# Altium project phase_shifter.PrjPcb
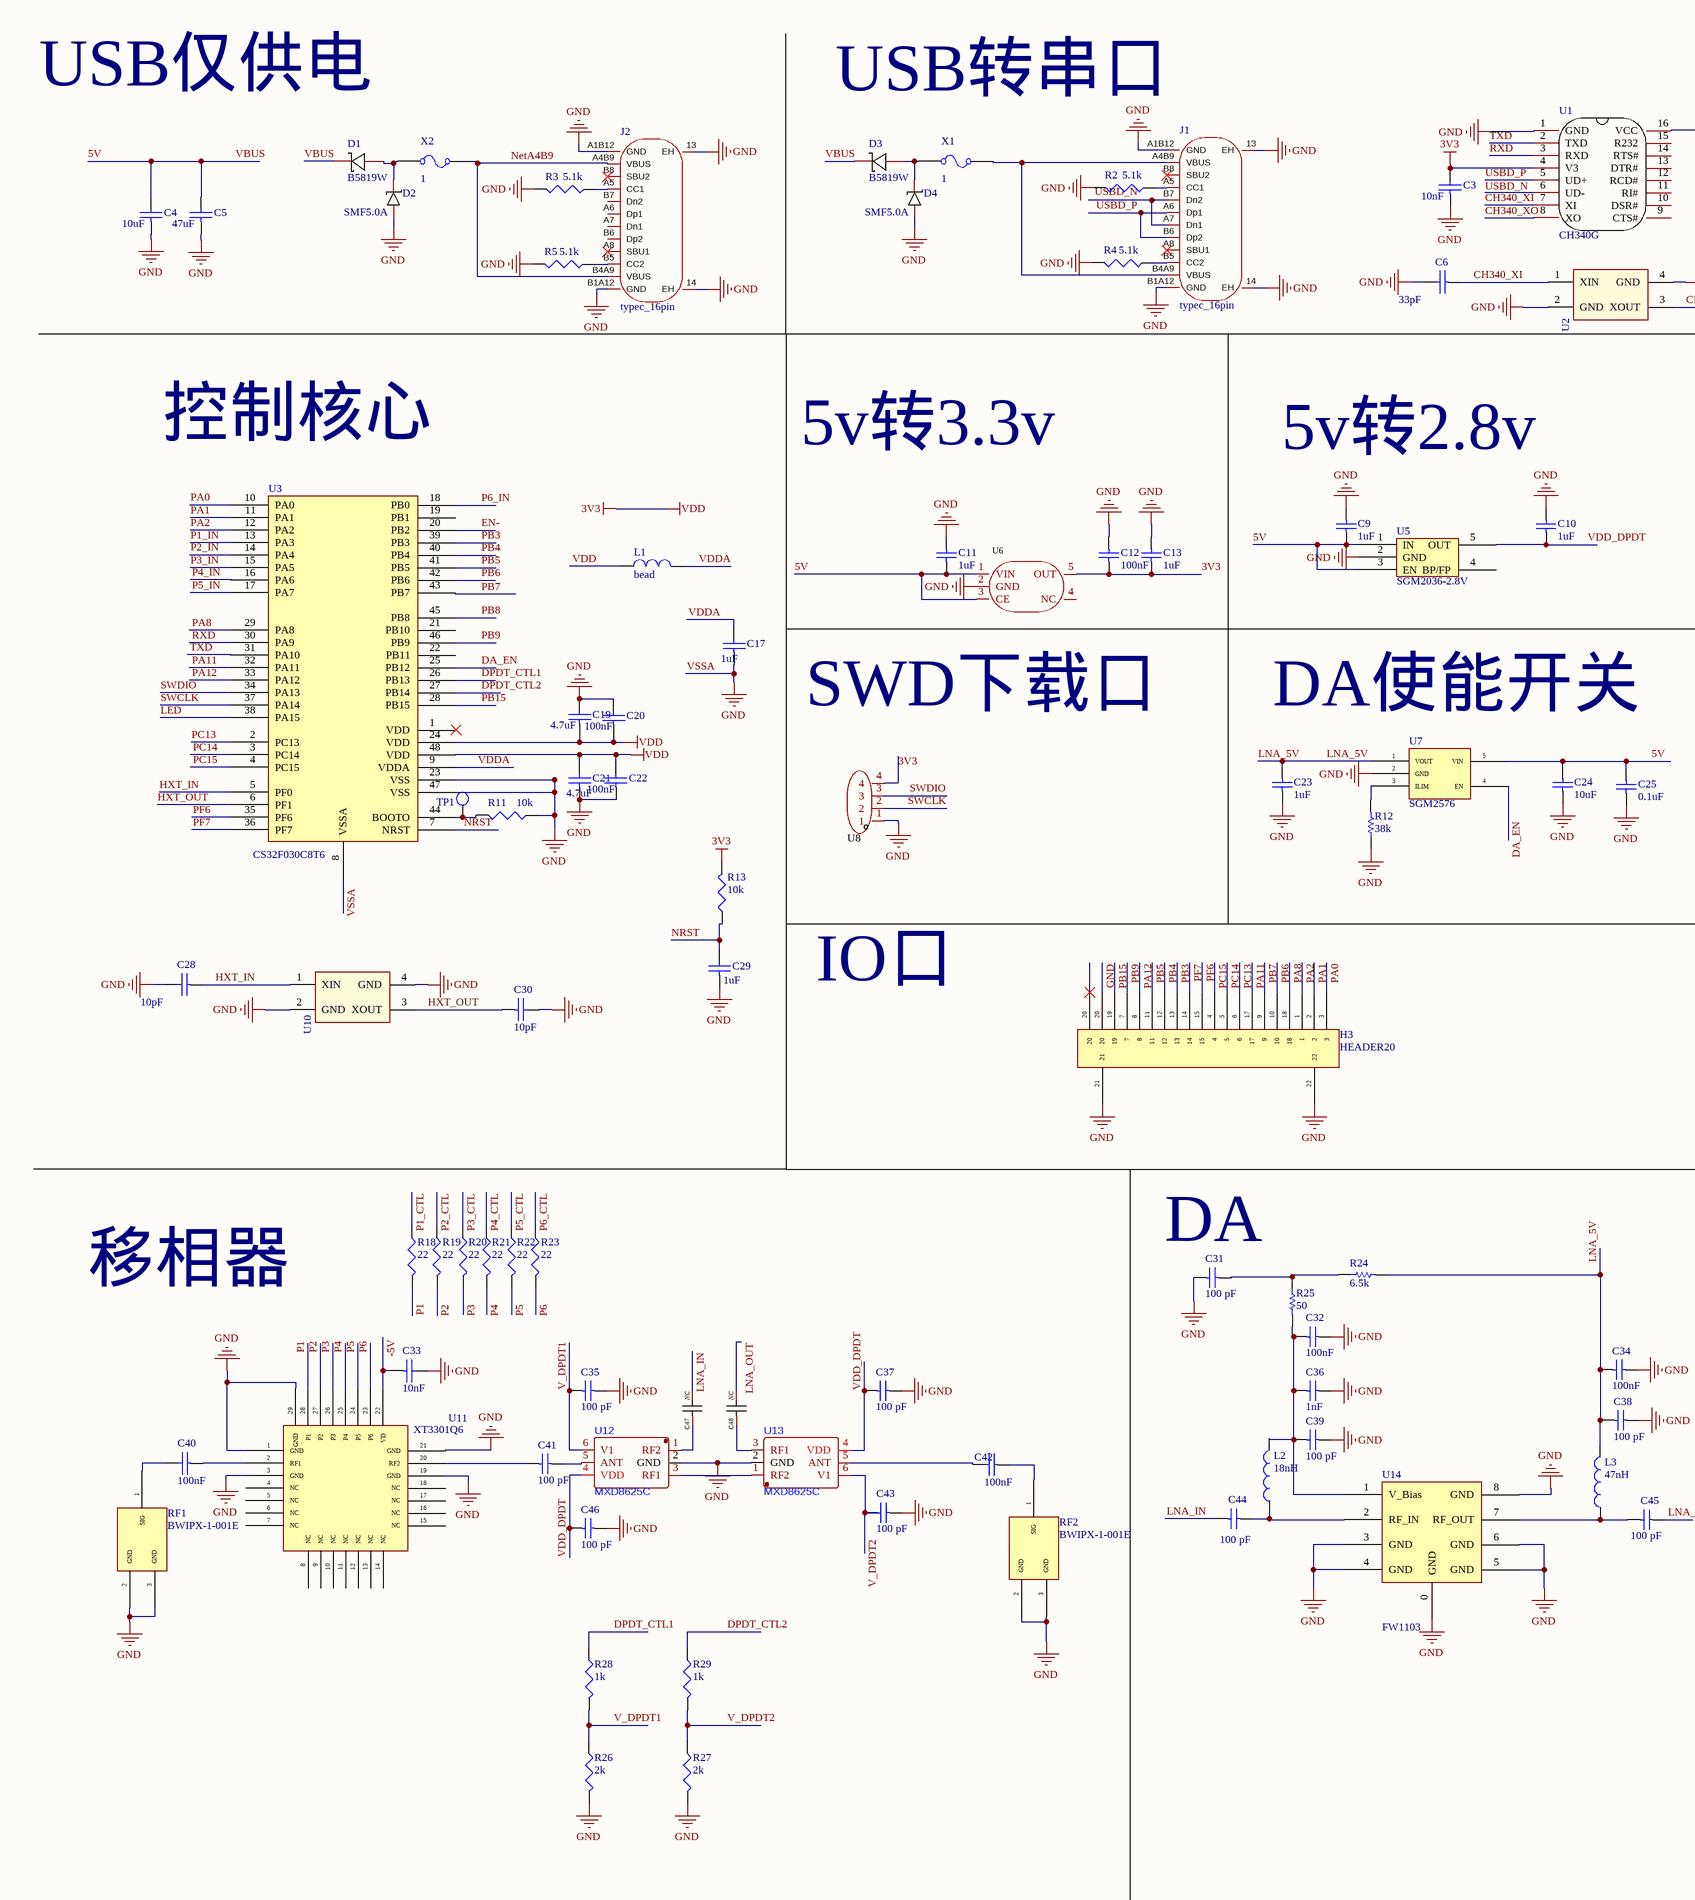
[diagram p0: SHIFTER.SchDoc, left]
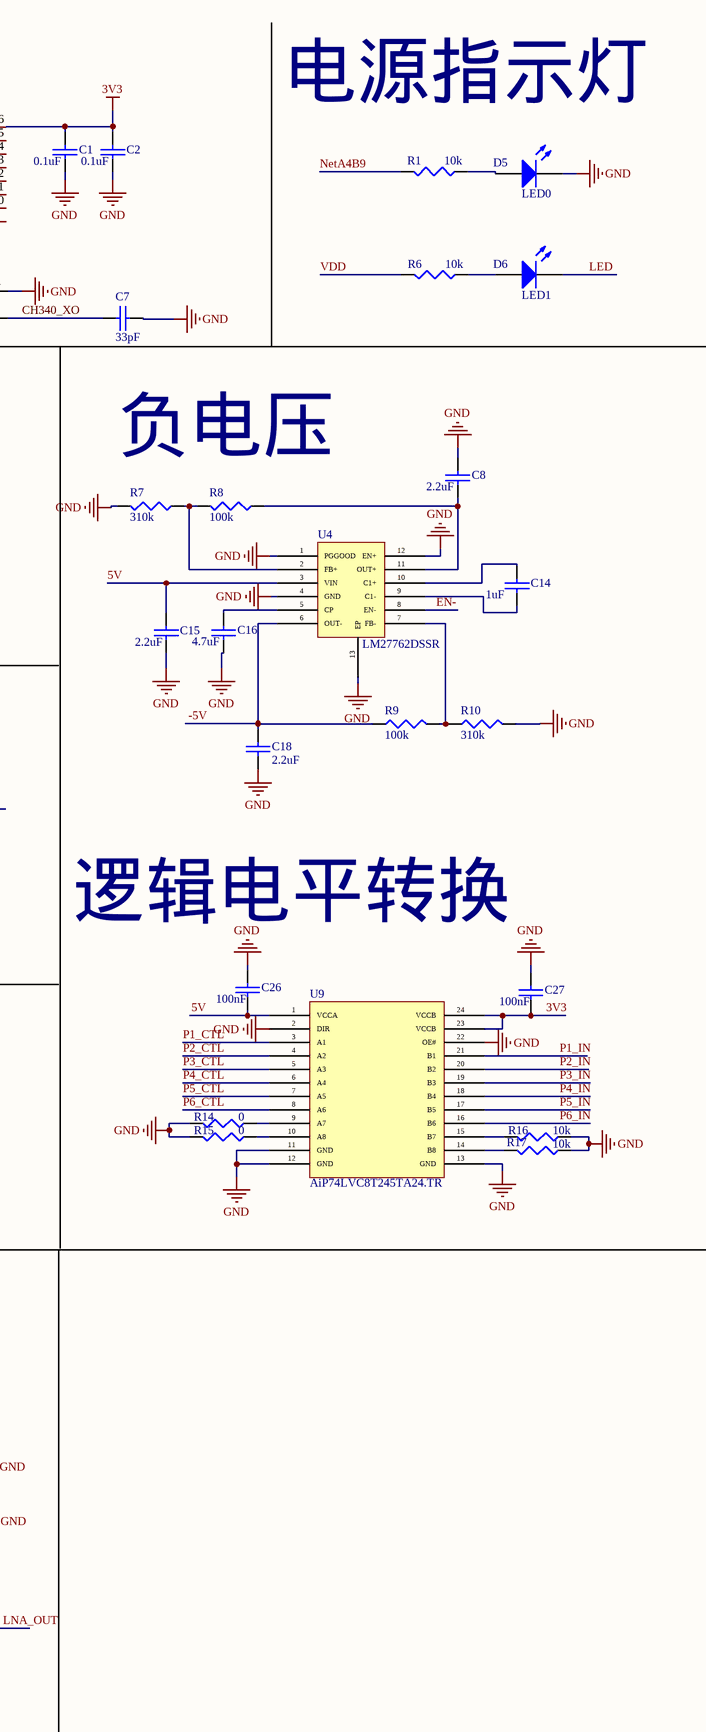
[diagram p1: SHIFTER.SchDoc, right]
6 sheets, 108 parts. Net scope: flat (ports and power ports of the same name join across sheets).
Board files: PHASE_SHIFTER.PcbDoc, shifter_V2.PcbDoc
Sheets:
  SHIFTER.SchDoc
  TOP.SchDoc

## Sheet SHIFTER.SchDoc
size A2; SheetNumber: 1; SheetTotal: 6

### Parts
C1  0.1uF  [0402_Z]
C2  0.1uF  [0402_Z]
C3  10nF  [0402_Z]
C4  10uF  [0603_Z]
C5  47uF  [0805]
C6  33pF  [0402_Z]
C7  33pF  [0402_Z]
C8  2.2uF  [0402_Z]
C9  1uF  [0603_Z]
C10  1uF  [0603_Z]
C11  1uF  [0603_Z]
C12  100nF  [0603_Z]
C13  1uF  [0603_Z]
C14  1uF  [0402_Z]
C15  2.2uF  [0402_Z]
C16  4.7uF  [0603_Z]
C17  1uF  [0402_Z]
C18  2.2uF  [0402_Z]
C19  4.7uF  [0603_Z]
C20  100nF  [0402_Z]
C21  4.7uF  [0603_Z]
C22  100nF  [0402_Z]
C23  1uF  [0603_Z]
C24  10uF  [0603_Z]
C25  0.1uF  [0402_Z]
C26  100nF  [0402_Z]
C27  100nF  [0402_Z]
C28  10pF  [0402_Z]
C29  1uF  [0402_Z]
C30  10pF  [0402_Z]
C31  100 pF  [0402_Z]
C32  100nF  [0402_Z]
C33  10nF  [0402_Z]
C34  100nF  [0402_Z]
C35  100 pF  [0402_Z]
C36  1nF  [0402_Z]
C37  100 pF  [0402_Z]
C38  100 pF  [0402_Z]
C39  100 pF  [0402_Z]
C40  100nF  [0603_Z]
C41  100 pF  [0402_Z]
C42  100nF  [0603_Z]
C43  100 pF  [0402_Z]
C44  100 pF  [0402_Z]
C45  100 pF  [0402_Z]
C46  100 pF  [0402_Z]
C47  NC  [0603_Z]  (no BOM)
C48  NC  [0603_Z]  (no BOM)
D1  B5819W  [BW5819W]
D2  SMF5.0A  [SMF5.0A]
D3  B5819W  [BW5819W]
D4  SMF5.0A  [SMF5.0A]
D5  LED0  [0603_Z]
D6  LED1  [0603_Z]
H3  HEADER20  [Header20]
J1  typec_16pin  [TYPEC_16PIN]
J2  typec_16pin  [TYPEC_16PIN]
L1  bead  [0603_Z]
L2  18nH  [0402_Z]
L3  47nH  [0402_Z]
R1  10k  [0402_Z]
R2  5.1k  [0402_Z]
R3  5.1k  [0402_Z]
R4  5.1k  [0402_Z]
R5  5.1k  [0402_Z]
R6  10k  [0402_Z]
R7  310k  [0402_Z]
R8  100k  [0402_Z]
R9  100k  [0402_Z]
R10  310k  [0402_Z]
R11  10k  [0402_Z]
R12  38k  [0402_Z]
R13  10k  [0402_Z]
R14  0  [0402_Z]
R15  0  [0402_Z]
R16  10k  [0402_Z]
R17  10k  [0402_Z]
R18  22  [0402_Z]
R19  22  [0402_Z]
R20  22  [0402_Z]
R21  22  [0402_Z]
R22  22  [0402_Z]
R23  22  [0402_Z]
R24  6.5k  [0402_Z]
R25  50  [0402_Z]
R26  2k  [0402_Z]
R27  2k  [0402_Z]
R28  1k  [0402_Z]
R29  1k  [0402_Z]
RF1  BWIPX-1-001E  [SMA-SMD_BWSMA-KE-P001]
RF2  BWIPX-1-001E  [SMA-SMD_BWSMA-KE-P001]
TP1  TP_P  [TP_0.8]  (value not drawn)
U1  CH340G  [CH340G]
U2  12MHz  [CRYSTAL-SMD_4P-L3.2-W2.5-BL]  (value not drawn)
U3  CS32F030C8T6  [LQPF48]
U4  LM27762DSSR  [LM27762]
U5  SGM2036-2.8V  [SOT-23-5]
U6  SGM2036-3.3YN5G/TR  [SOT-23-5]  (value not drawn)
U7  SGM2576  [SGM2576]
U8  HDGC1251WR-4P  [J4_1.25]  (value not drawn)
U9  AiP74LVC8T245TA24.TR  [AIP74LVC8T245TA24.TR]
U10  8MHz  [CRYSTAL-SMD_4P-L3.2-W2.5-BL]  (value not drawn)
U11  XT3301Q6  [XT3301Q6]
U12  MXD8625C  [MXD8625C]
U13  MXD8625C  [MXD8625C]
U14  FW1103  [FW1103W]
X1  CURRENT: 1  [F1206]  (hidden comment: Fuse)
X2  CURRENT: 1  [F1206]  (hidden comment: Fuse)

### Nets
3V3: C1.2 C2.2 C3.2 C12.1 C13.1 C19.1 C20.1 C21.2 C22.2 C27.1 L1.1 R6.2 R13.2 U1.4(V3) U1.16(VCC) U3.24(VDD) U3.48(VDD) U6.5(OUT) U8.4 U9.23(VCCB) U9.24(VCCB)  [also labelled VDD]
GND: C1.1 C2.1 C3.1 C4.1 C5.1 C6.2 C7.2 C8.2 C9.2 C10.2 C11.2 C12.2 C13.2 C15.1 C16.1 C17.1 C18.2 C19.2 C20.2 C21.1 C22.1 C23.1 C24.1 C25.1 C26.2 C27.2 C28.2 C29.1 C30.2 C31.2 C32.1 C33.2 C34.1 C35.1 C36.1 C37.1 C38.1 C39.1 C43.1 C46.1 D2.2 D4.2 D5.2(K) H3.20 H3.21 H3.22 J1.13(EH) J1.14(EH) J1.A1B12(GND) J1.B1A12(GND) J2.13(EH) J2.14(EH) J2.A1B12(GND) J2.B1A12(GND) R2.2 R3.2 R4.2 R5.2 R7.2 R10.2 R11.1 R12.1 R14.2 R15.2 R16.1 R17.1 R26.2 R27.2 RF1.2(GND) RF1.3(GND) RF2.2(GND) RF2.3(GND) U1.1(GND) U2.2(GND) U2.4(GND) U3.8(VSSA) U3.23(VSS) U3.47(VSS) U4.1(PGGOOD) U4.4(GND) U4.12(EN+) U4.13(EP) U5.2(GND) U6.2(GND) U7.2(GND) U8.1 U9.2(DIR) U9.11(GND) U9.12(GND) U9.13(GND) U9.22(OE#) U10.2(GND) U10.4(GND) U11.1(GND) U11.3(GND) U11.19(GND) U11.21(GND) U11.29(GND) U12.2(GND) U13.2(GND) U14.0(GND) U14.3(GND) U14.4(GND) U14.5(GND) U14.6(GND) U14.8(GND)  [also labelled VSSA]
5V: C4.2 C5.2 C9.1 C11.1 C15.2 C24.2 C25.2 C26.1 D1.1(K) D3.1(K) U4.3(VIN) U5.1(IN) U5.3(EN) U6.1(VIN) U6.3(CE) U7.5(VIN) U9.1(VCCA)  [also labelled VBUS]
-5V: C18.1 C33.1 R9.1 U4.6(OUT-) U11.22(VD)
\: R28.1 U3.26(PB13)  [also labelled DPDT_CTL1]
CH340_XI: C6.1 U1.7(XI) U2.1(XIN)
CH340_XO: C7.1 U1.8(XO) U2.3(XOUT)
DA_EN: U3.25(PB12) U7.4(EN)
DPDT_CTL2: R29.1 U3.27(PB14)
EN-: U3.20(PB2) U4.8(EN-)
HXT_IN: C28.1 U3.5(PF0) U10.1(XIN)
HXT_OUT: C30.1 U3.6(PF1) U10.3(XOUT)
LED: D6.2(K) U3.38(PA15)
LNA_5V: C23.2 C34.2 C38.2 L3.2 R24.2 U7.1(VOUT)
LNA_IN: C44.2 C47.2
LNA_OUT: C45.1 C48.2
NetA4B9: J2.A4B9(VBUS) J2.B4A9(VBUS) R1.2 X2.2
NRST: C29.2 R13.1 U3.7(NRST)
P1: R18.2 U11.28(P1)
P1_CTL: R18.1 U9.3(A1)
P1_IN: U3.13(PA3) U9.21(B1)
P2: R19.2 U11.27(P2)
P2_CTL: R19.1 U9.4(A2)
P2_IN: U3.14(PA4) U9.20(B2)
P3: R20.2 U11.26(P3)
P3_CTL: R20.1 U9.5(A3)
P3_IN: U3.15(PA5) U9.19(B3)
P4: R21.2 U11.25(P4)
P4_CTL: R21.1 U9.6(A4)
P4_IN: U3.16(PA6) U9.18(B4)
P5: R22.2 U11.24(P5)
P5_CTL: R22.1 U9.7(A5)
P5_IN: U3.17(PA7) U9.17(B5)
P6: R23.2 U11.23(P6)
P6_CTL: R23.1 U9.8(A6)
P6_IN: U3.18(PB0) U9.16(B6)
PA0: H3.3 U3.10(PA0)
PA1: H3.2 U3.11(PA1)
PA2: H3.1 U3.12(PA2)
PA8: H3.18 U3.29(PA8)
PA11: H3.17 U3.32(PA11)
PA12: H3.8 U3.33(PA12)
PB3: H3.13 U3.39(PB3)
PB4: H3.12 U3.40(PB4)
PB5: H3.11 U3.41(PB5)
PB6: H3.10 U3.42(PB6)
PB7: H3.9 U3.43(PB7)
PB8: U3.45(PB8)
PB9: H3.7 U3.46(PB9)
PB15: H3.19 U3.28(PB15)
PC13: H3.6 U3.2(PC13)
PC14: H3.5 U3.3(PC14)
PC15: H3.4 U3.4(PC15)
PF6: H3.15 U3.35(PF6)
PF7: H3.14 U3.36(PF7)
RXD: U1.3(RXD) U3.30(PA9)
SWCLK: U3.37(PA14) U8.2
SWDIO: U3.34(PA13) U8.3
TXD: U1.2(TXD) U3.31(PA10)
USBD_P: J1.A6(Dp1) J1.B6(Dp2) U1.5(UD+)
V_DPDT1: C35.2 R26.1 R28.2 U12.6(V1)
V_DPDT2: R27.1 R29.2
VDD_DPDT: C10.1 C37.2 C46.2 U5.5(OUT) U12.4(VDD) U13.4(VDD)
VDDA: C17.2 L1.2 U3.9(VDDA)
NetC8_1: C8.1 R8.1 U4.11(OUT+)
NetC14_1: C14.1 U4.9(C1-)
NetC14_2: C14.2 U4.10(C1+)
NetC16_2: C16.2 U4.5(CP)
NetC31_1: C31.1 R24.1 R25.1
NetC32_2: C32.2 C36.2 C39.2 L2.2 R25.2 U14.1(V_Bias)
NetC40_1: C40.1 U11.2(RF1)
NetC40_2: C40.2 RF1.1(SIG)
NetC41_1: C41.1 U12.5(ANT)
NetC41_2: C41.2 U11.20(RF2)
NetC42_1: C42.1 RF2.1(SIG)
NetC42_2: C42.2 U13.5(ANT)
NetC43_2: C43.2 U13.6(V1)
NetC44_1: C44.1 L2.1 U14.2(RF_IN)
NetC45_2: C45.2 L3.1 U14.7(RF_OUT)
NetC47_1: C47.1 U12.1(RF2)
NetC48_1: C48.1 U13.3(RF1)
NetD1_2: D1.2(A) D2.1 X2.1
NetD3_2: D3.2(A) D4.1 X1.1
NetD5_1: D5.1(A) R1.1
NetD6_1: D6.1(A) R6.1
NetJ1_A4B9: J1.A4B9(VBUS) J1.B4A9(VBUS) X1.2
NetJ1_A5: J1.A5(CC1) R2.1
NetJ1_A7: J1.A7(Dn1) J1.B7(Dn2)
NetJ1_B5: J1.B5(CC2) R4.1
NetJ2_A5: J2.A5(CC1) R3.1
NetJ2_B5: J2.B5(CC2) R5.1
NetR7_1: R7.1 R8.2 U4.2(FB+)
NetR9_2: R9.2 R10.1 U4.7(FB-)
NetR11_2: R11.2 TP1.1 U3.44(BOOTO)
NetR12_2: R12.2 U7.3(ILIM)
NetR14_1: R14.1 U9.9(A7)
NetR15_1: R15.1 U9.10(A8)
NetR16_2: R16.2 U9.15(B7)
NetR17_2: R17.2 U9.14(B8)
NetU12_3: U12.3(RF1) U13.1(RF2)

Not connected (* = marked no-connect by the designer): J1 A8(SBU1)* B8(SBU2)*; J2 A6(Dp1) A7(Dn1) A8(SBU1)* B6(Dp2) B7(Dn2) B8(SBU2)*; U1 6(UD-) 9(CTS#) 10(DSR#) 11(RI#) 12(RCD#) 13(DTR#) 14(RTS#) 15(R232); U3 1(VDD) 19(PB1) 21(PB10) 22(PB11); U5 4(BP/FP); U6 4(NC); U11 4(NC) 5(NC) 6(NC) 7(NC) 8(NC) 9(NC) 10(NC) 11(NC) 12(NC) 13(NC) 14(NC) 15(NC) 16(NC) 17(NC) 18(NC)

### Notes on the sheet
- USB仅供电
- USB转串口
- 电源指示灯
- 控制核心
- 5v转3.3v
- 5v转2.8v
- 负电压
- SWD下载口
- DA使能开关
- (near C26) 逻辑电平转换
- IO口
- 移相器
- (near C31) DA
- Labels drawn without touching a wire or pin: USBD_N

### Library data of the parts
C1-C8 C14-C22 C26-C30 C33 C40 C42 = CAP: 0402; Value: 20pF  NP0
C9-C13 C23-C25 C31 C32 C34-C39 C41 C43-C46 = Cap: Capacitor; Value: 100pF; Published: 8-Jun-2000; LatestRevisionDate: 17-Jul-2002; LatestRevisionNote: Re-released for DXP Platform.; PackageReference: RAD-0.3; Publisher: Altium Limited; PackageDescription: Radial Cap, Thru-Hole; 2 Leads; 0.3 in Pin Spacing
C47 C48 = Cap_NC
D1 D3 = B5819W: 肖特基二极管
D5 D6 = LED0: Typical INFRARED GaAs LED; Published: 8-Jun-2000; LatestRevisionDate: 08-Jul-2005; LatestRevisionNote: Mech Layer 1 removed.; PackageReference: LED-0; Publisher: Altium Limited; PackageDescription: LED; 2 Leads
L1 = INDUCTOR1_1: INDUCTOR; Value: 33nH
L2 L3 = Inductor: Code_IEC: 1005; Value: 10mH; Published: 8-Jun-2000; LatestRevisionDate: 29-May-2009; LatestRevisionNote: IPC-7351 Footprint Added.; PackageReference: 0402-A; Publisher: Altium Limited; PackageDescription: Chip Inductor; Code_JEITA: 0402
R1-R11 R13-R23 R26-R29 = Res3: Resistor; Published: 8-Jun-2000; LatestRevisionDate: 04-Mar-2005; LatestRevisionNote: PCB Footprint replaced.; PackageReference: J1-0603; Publisher: Altium Limited
  R1 R6 R11 R13 R16 R17: Value: 10k
  R2-R5: Value: 5.1k
  R7 R10: Value: 310k
  R8 R9: Value: 100k
  R14 R15: Value: 0
  R18-R23: Value: 22
  R26 R27: Value: 2k
  R28 R29: Value: 1k
R12 R24 R25 = Res1: Resistor; Value: 1K; Published: 8-Jun-2000; LatestRevisionDate: 17-Jul-2002; LatestRevisionNote: Re-released for DXP Platform.; PackageReference: AXIAL-0.3; Publisher: Altium Limited; PackageDescription: Axial Device, Thru-Hole; 2 Leads; 0.3 in Pin Spacing
U2 U10 = XTAL 3225: PCB DECAL: 3225; Source_Path: E:\LI LELE\DESIGN KIT\DESIGN KIT_ESP8089_DEMO\ESP8089_DEMO.DSN
U5 = sgm2036
U6 = LDO_ADJ_SGM2036: 0.8V-5V可调输出线性稳压器; Designer: U?; Symbol: SGM2036-3.3YN5G/TR; Device: SGM2036-3.3YN5G/TR
U8 = MX1.25_弯针: 复旦微单片机程序下载接口; Manufacturer: HDGC(华德共创); Add into BOM: yes; Name: HDGC1251WR-4P; Symbol: HDGC1251WR-4P; Device: HDGC1251WR-4P; LCSC Part Name: MX1.25弯针 4P; Supplier Part: C5175205; Manufacturer Part: HDGC1251WR-4P; Supplier Footprint: 直插,P=1.25mm; JLCPCB Part Class: Extended Part; Datasheet: https://atta.szlcsc.com/upload/public/pdf/source/20220916/6B39EFECC0008CEF03BA0E93409F6DCC.pdf; Supplier: LCSC; Convert to PCB: yes
U9 = AiP74LVC8T245TA24.TR: 具有三态输出的8位双电源转换收发器，可实现双向电平转换
X1 X2 = Fuse: RESISTANCE: 1m; SimulationGenericComponent: True

## Sheet TOP.SchDoc
size A2; SheetNumber: 6; SheetTotal: 6
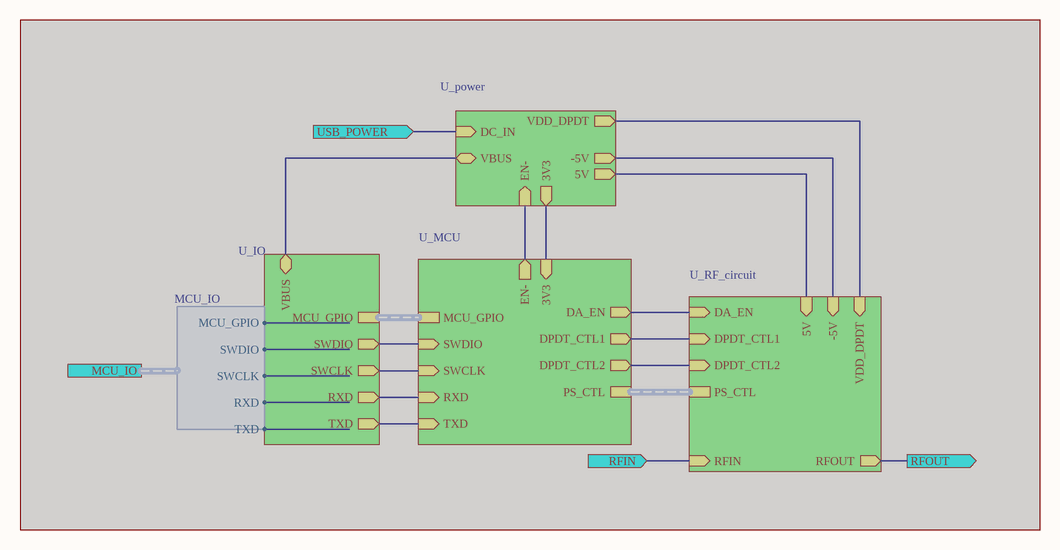
[diagram p2: TOP.SchDoc]

### Sub-sheets
U_IO = IO.SchDoc (masked out): SWDIO (out), SWCLK (out), MCU_GPIO (harness MCU_GPIO), TXD (out), RXD (out), VBUS (bidir)
U_MCU = MCU.SchDoc (masked out): MCU_GPIO (harness MCU_GPIO), 3V3 (in), EN- (out), DA_EN (out), DPDT_CTL1 (out), DPDT_CTL2 (out), SWDIO (in), SWCLK (in), RXD (in), TXD (in), PS_CTL (harness PS_CTL)
U_power = power.SchDoc (masked out): 3V3 (out), VDD_DPDT (out), -5V (out), 5V (out), EN- (in), VBUS (bidir), DC_IN (in)
U_RF_circuit = RF_circuit.SchDoc (masked out): -5V (in), DPDT_CTL1 (in), DPDT_CTL2 (in), PS_CTL (harness PS_CTL), DA_EN (in), VDD_DPDT (in), 5V (in), RFIN (in), RFOUT (out)

### Ports
MCU_IO (harness MCU_IO), RFIN (in), RFOUT (out), USB_POWER (in)

### Harnesses
MCU_IO: MCU_GPIO, SWDIO, SWCLK, RXD, TXD